# EasyEDA Pro project honglin-first_crt_smartphone-e4cb491d.epro, schematic Schematic2
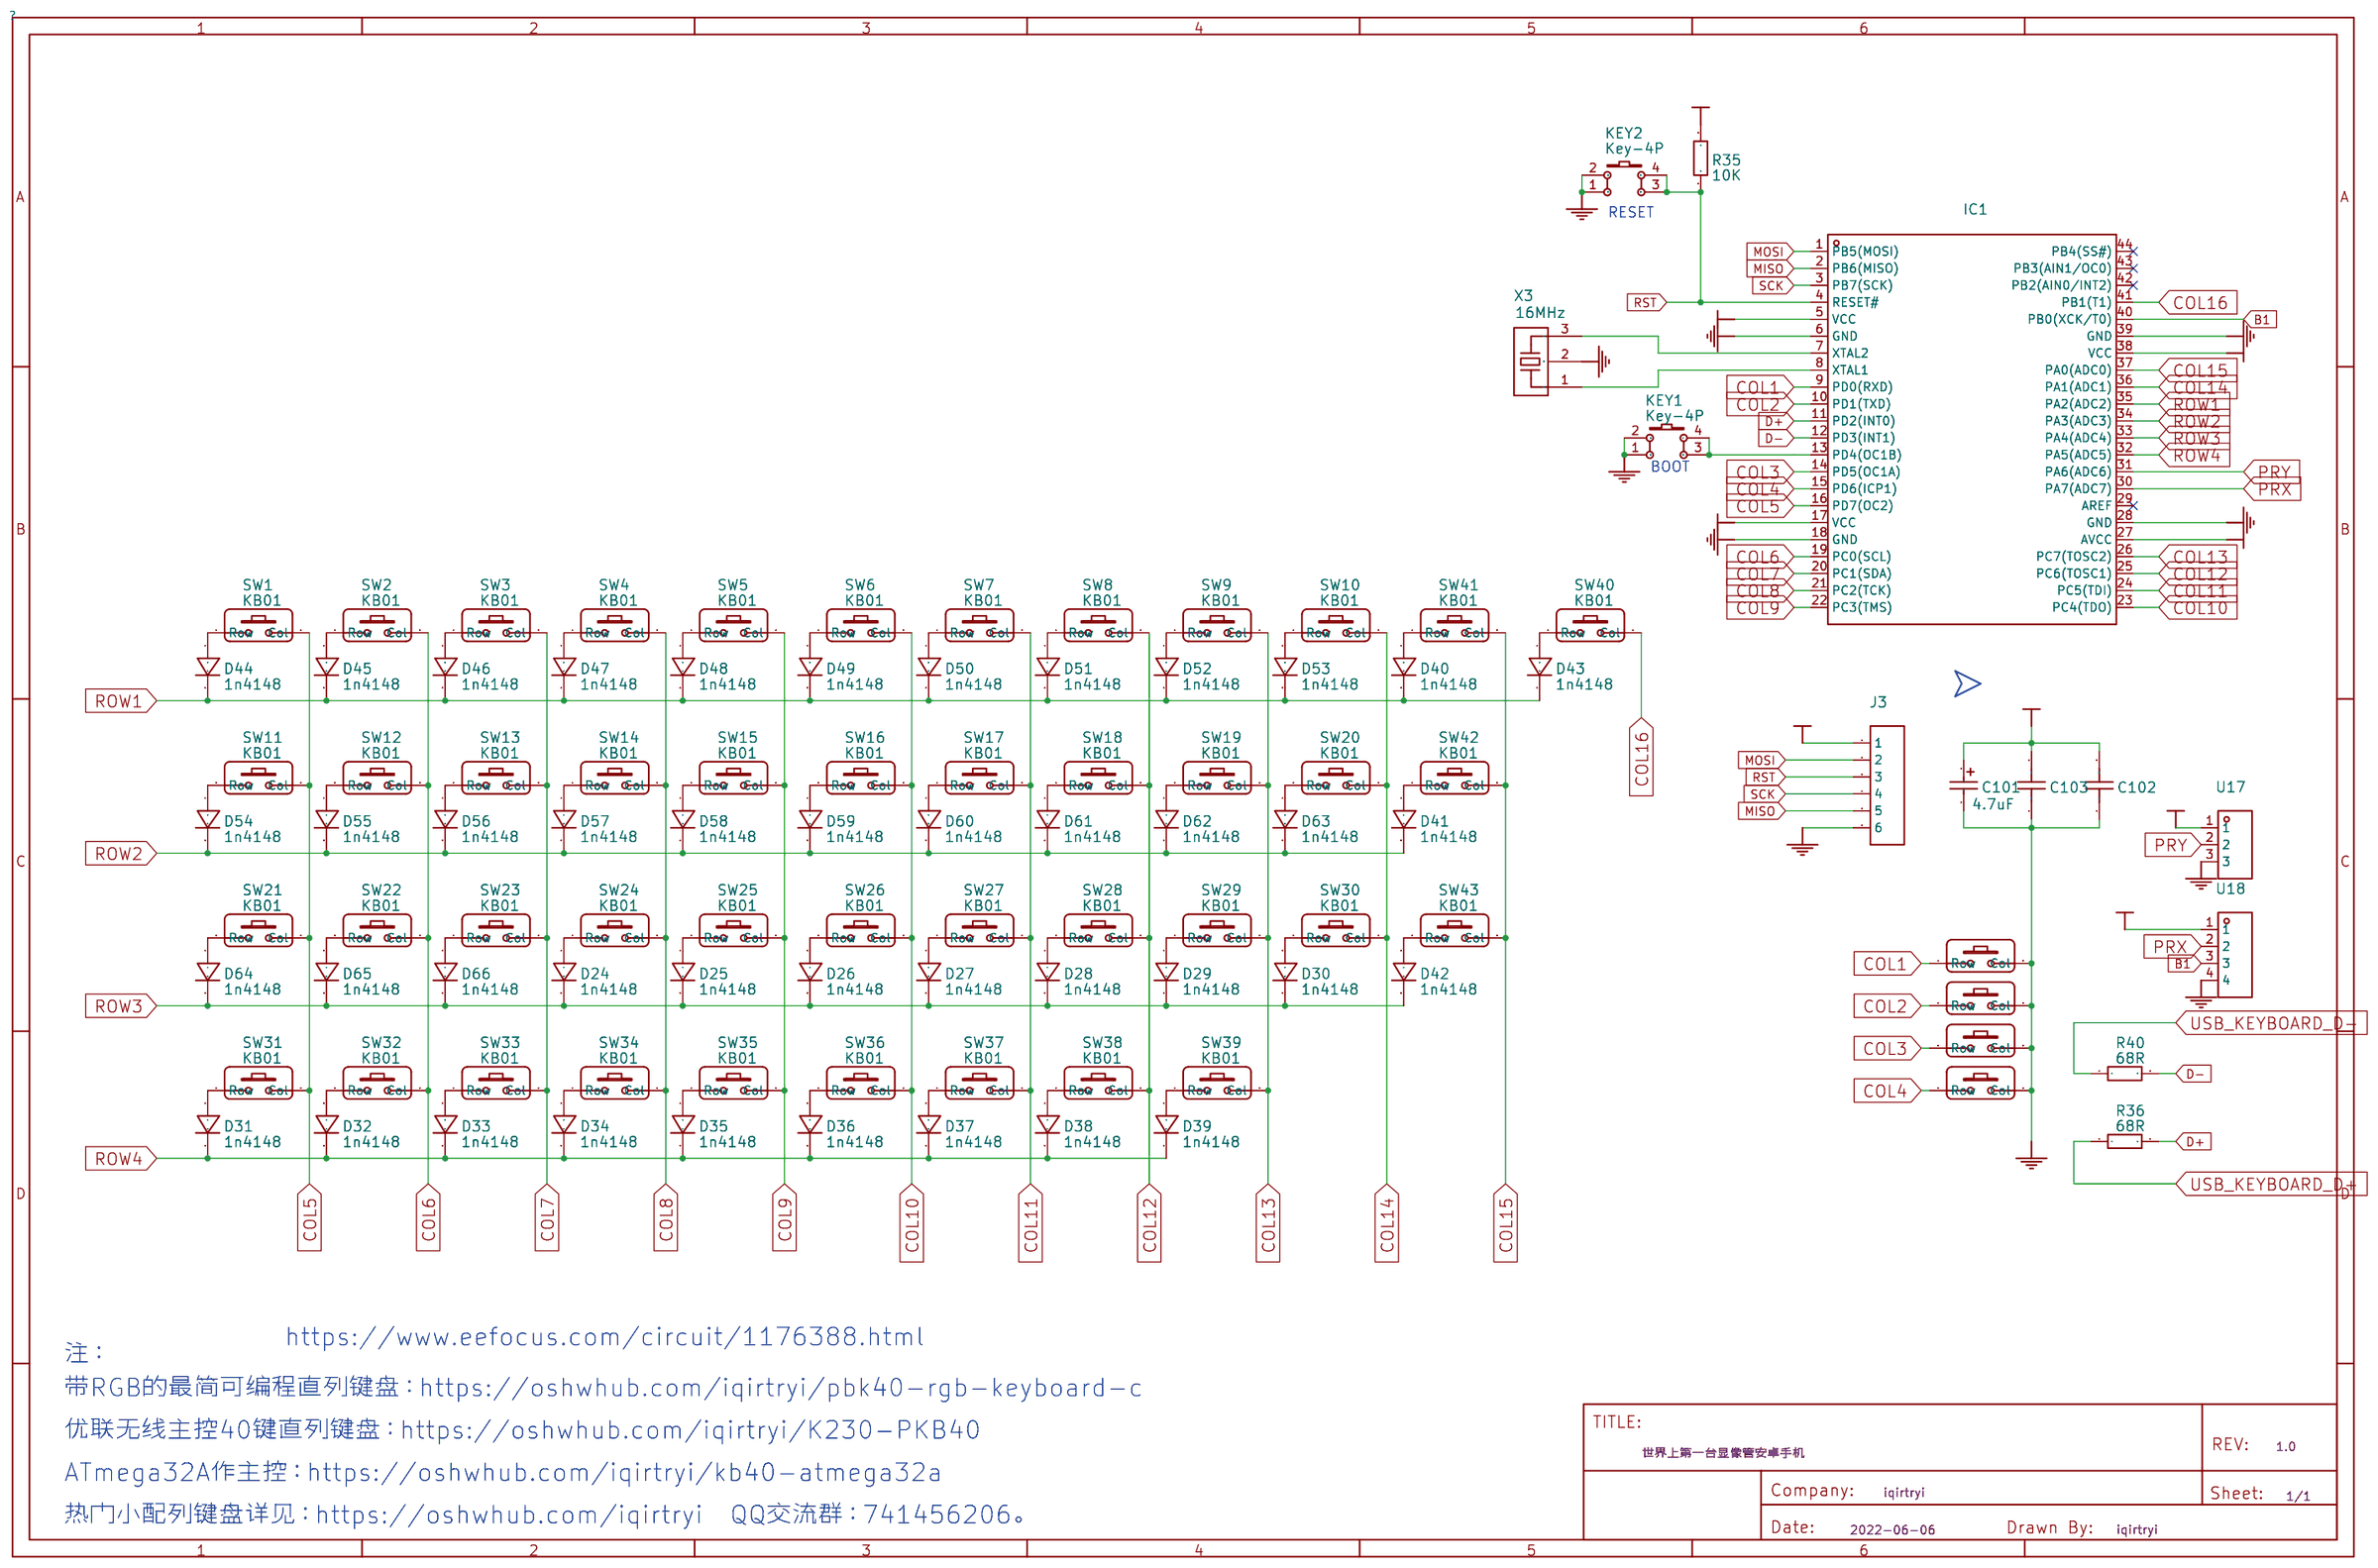
[diagram p6: schematic sheet]

## Parts
C101  4.7uF  [CAP-SMD_L3.2-W1.6-R-RD]
C102  0.1uF  [C0805]
C103  0.1uF  [C0805]
D24  1n4148  [LL-34_L3.5-W1.5-RD01]
D25  1n4148  [LL-34_L3.5-W1.5-RD01]
D26  1n4148  [LL-34_L3.5-W1.5-RD01]
D27  1n4148  [LL-34_L3.5-W1.5-RD01]
D28  1n4148  [LL-34_L3.5-W1.5-RD01]
D29  1n4148  [LL-34_L3.5-W1.5-RD01]
D30  1n4148  [LL-34_L3.5-W1.5-RD01]
D31  1n4148  [LL-34_L3.5-W1.5-RD01]
D32  1n4148  [LL-34_L3.5-W1.5-RD01]
D33  1n4148  [LL-34_L3.5-W1.5-RD01]
D34  1n4148  [LL-34_L3.5-W1.5-RD01]
D35  1n4148  [LL-34_L3.5-W1.5-RD01]
D36  1n4148  [LL-34_L3.5-W1.5-RD01]
D37  1n4148  [LL-34_L3.5-W1.5-RD01]
D38  1n4148  [LL-34_L3.5-W1.5-RD01]
D39  1n4148  [LL-34_L3.5-W1.5-RD01]
D40  1n4148  [LL-34_L3.5-W1.5-RD01]
D41  1n4148  [LL-34_L3.5-W1.5-RD01]
D42  1n4148  [LL-34_L3.5-W1.5-RD01]
D43  1n4148  [LL-34_L3.5-W1.5-RD01]
D44  1n4148  [LL-34_L3.5-W1.5-RD01]
D45  1n4148  [LL-34_L3.5-W1.5-RD01]
D46  1n4148  [LL-34_L3.5-W1.5-RD01]
D47  1n4148  [LL-34_L3.5-W1.5-RD01]
D48  1n4148  [LL-34_L3.5-W1.5-RD01]
D49  1n4148  [LL-34_L3.5-W1.5-RD01]
D50  1n4148  [LL-34_L3.5-W1.5-RD01]
D51  1n4148  [LL-34_L3.5-W1.5-RD01]
D52  1n4148  [LL-34_L3.5-W1.5-RD01]
D53  1n4148  [LL-34_L3.5-W1.5-RD01]
D54  1n4148  [LL-34_L3.5-W1.5-RD01]
D55  1n4148  [LL-34_L3.5-W1.5-RD01]
D56  1n4148  [LL-34_L3.5-W1.5-RD01]
D57  1n4148  [LL-34_L3.5-W1.5-RD01]
D58  1n4148  [LL-34_L3.5-W1.5-RD01]
D59  1n4148  [LL-34_L3.5-W1.5-RD01]
D60  1n4148  [LL-34_L3.5-W1.5-RD01]
D61  1n4148  [LL-34_L3.5-W1.5-RD01]
D62  1n4148  [LL-34_L3.5-W1.5-RD01]
D63  1n4148  [LL-34_L3.5-W1.5-RD01]
D64  1n4148  [LL-34_L3.5-W1.5-RD01]
D65  1n4148  [LL-34_L3.5-W1.5-RD01]
D66  1n4148  [LL-34_L3.5-W1.5-RD01]
IC1  ATMEGA32A-AU  [TQFP-44_L10.0-W10.0-P0.80-LS12.0-BL]
J3  Pin06  [PIN06]  (no BOM)
KEY1  Key-4P  [SW-SMD_4P-L5.1-W5.1-P3.70-LS6.5-TL-2]
KEY2  Key-4P  [SW-SMD_4P-L5.1-W5.1-P3.70-LS6.5-TL-2]
R35  10K  [R0805]
R36  68R  [R0805]
R40  68R  [R0805]
SW1  KB01  [6*6*5硅胶开关]
SW2  KB01  [6*6*5硅胶开关]
SW3  KB01  [6*6*5硅胶开关]
SW4  KB01  [6*6*5硅胶开关]
SW5  KB01  [6*6*5硅胶开关]
SW6  KB01  [6*6*5硅胶开关]
SW7  KB01  [6*6*5硅胶开关]
SW8  KB01  [6*6*5硅胶开关]
SW9  KB01  [6*6*5硅胶开关]
SW10  KB01  [6*6*5硅胶开关]
SW11  KB01  [6*6*5硅胶开关]
SW12  KB01  [6*6*5硅胶开关]
SW13  KB01  [6*6*5硅胶开关]
SW14  KB01  [6*6*5硅胶开关]
SW15  KB01  [6*6*5硅胶开关]
SW16  KB01  [6*6*5硅胶开关]
SW17  KB01  [6*6*5硅胶开关]
SW18  KB01  [6*6*5硅胶开关]
SW19  KB01  [6*6*5硅胶开关]
SW20  KB01  [6*6*5硅胶开关]
SW21  KB01  [6*6*5硅胶开关]
SW22  KB01  [6*6*5硅胶开关]
SW23  KB01  [6*6*5硅胶开关]
SW24  KB01  [6*6*5硅胶开关]
SW25  KB01  [6*6*5硅胶开关]
SW26  KB01  [6*6*5硅胶开关]
SW27  KB01  [6*6*5硅胶开关]
SW28  KB01  [6*6*5硅胶开关]
SW29  KB01  [6*6*5硅胶开关]
SW30  KB01  [6*6*5硅胶开关]
SW31  KB01  [6*6*5硅胶开关]
SW32  KB01  [6*6*5硅胶开关]
SW33  KB01  [6*6*5硅胶开关]
SW34  KB01  [6*6*5硅胶开关]
SW35  KB01  [6*6*5硅胶开关]
SW36  KB01  [6*6*5硅胶开关]
SW37  KB01  [6*6*5硅胶开关]
SW38  KB01  [6*6*5硅胶开关]
SW39  KB01  [6*6*5硅胶开关]
SW40  KB01  [6*6*5硅胶开关]
SW41  KB01  [6*6*5硅胶开关]
SW42  KB01  [6*6*5硅胶开关]
SW43  KB01  [6*6*5硅胶开关]
SW44  KB01  [6*6*5硅胶开关]
SW45  KB01  [6*6*5硅胶开关]
SW46  KB01  [6*6*5硅胶开关]
SW47  KB01  [6*6*5硅胶开关]
U17  XH2.54-3P 直插  [CONN-TH_XH2.54-3P]
U18  XH2.54_4P_直插  [CONN-TH_4P-P2.50-XH2.54-4P]
X3  16MHz  [OSC-SMD_3P-L3.2-W1.3-P1.2-L]

## Library data of the parts
C101 = TAJA106K010RNJ: Supplier: LCSC; Manufacturer: AVX; Supplier Part: C7177; JLCPCB Part Class: Extend
C102 C103 = 0.1uF: Supplier: LCSC; Supplier Part: C302043
D24-D66 = MCL4148-TR3: Supplier: LCSC; Manufacturer: VISHAY; Supplier Part: C146440; JLCPCB Part Class: Extended Part
IC1 = ATMEGA32A-AU: Supplier: LCSC; Manufacturer: MICROCHIP; Supplier Part: C5659; JLCPCB Part Class: Extended Part
J3 = Pin06: Supplier Part: C190819; Supplier: LCSC
KEY1 KEY2 = K2-1103DP-M4SW-04: Supplier Part: C1121873; Supplier: LCSC; Manufacturer: XKB Connectivity
R35 R36 R40 = QR0805F1KP05: Supplier: LCSC; Supplier Part: C176197; Manufacturer: Ever Ohms Tech
SW1-SW47 = 00
U17 = XH2.54-3P 直插: Supplier: LCSC; Supplier Part: C9900000727; Manufacturer: null; JLCPCB Part Class: Extended Part
U18 = XH2.54_4P_直插: Supplier: LCSC; Supplier Part: C9900008616; Manufacturer: null; JLCPCB Part Class: Extended Part
X3 = CSTCE16M0V53C-R0: Supplier: LCSC; Manufacturer: MuRata; Supplier Part: C91584

## Nets
GND: C101.2 C102.1 C103.1 IC1.6(GND) IC1.18(GND) IC1.28(GND) IC1.39(GND) J3.6 KEY1.1 KEY1.2 KEY2.1 KEY2.2 SW44.2(Col) SW45.2(Col) SW46.2(Col) SW47.2(Col) U17.3 U18.4 X3.2
VCC: C101.1 C102.2 C103.2 IC1.5(VCC) IC1.17(VCC) IC1.27(AVCC) IC1.38(VCC) J3.1 R35.2
B1: IC1.40(PB0(XCK/T0)) U18.3
BLDO2: U17.1 U18.1
COL1: IC1.9(PD0(RXD)) SW44.1(Row)
COL2: IC1.10(PD1(TXD)) SW45.1(Row)
COL3: IC1.14(PD5(OC1A)) SW46.1(Row)
COL4: IC1.15(PD6(ICP1)) SW47.1(Row)
COL5: IC1.16(PD7(OC2)) SW1.2(Col) SW11.2(Col) SW21.2(Col) SW31.2(Col)
COL6: IC1.19(PC0(SCL)) SW2.2(Col) SW12.2(Col) SW22.2(Col) SW32.2(Col)
COL7: IC1.20(PC1(SDA)) SW3.2(Col) SW13.2(Col) SW23.2(Col) SW33.2(Col)
COL8: IC1.21(PC2(TCK)) SW4.2(Col) SW14.2(Col) SW24.2(Col) SW34.2(Col)
COL9: IC1.22(PC3(TMS)) SW5.2(Col) SW15.2(Col) SW25.2(Col) SW35.2(Col)
COL10: IC1.23(PC4(TDO)) SW6.2(Col) SW16.2(Col) SW26.2(Col) SW36.2(Col)
COL11: IC1.24(PC5(TDI)) SW7.2(Col) SW17.2(Col) SW27.2(Col) SW37.2(Col)
COL12: IC1.25(PC6(TOSC1)) SW8.2(Col) SW18.2(Col) SW28.2(Col) SW38.2(Col)
COL13: IC1.26(PC7(TOSC2)) SW9.2(Col) SW19.2(Col) SW29.2(Col) SW39.2(Col)
COL14: IC1.36(PA1(ADC1)) SW10.2(Col) SW20.2(Col) SW30.2(Col)
COL15: IC1.37(PA0(ADC0)) SW41.2(Col) SW42.2(Col) SW43.2(Col)
COL16: IC1.41(PB1(T1)) SW40.2(Col)
D+: IC1.11(PD2(INT0)) R36.2
D-: IC1.12(PD3(INT1)) R40.2
MISO: IC1.2(PB6(MISO)) J3.5
MOSI: IC1.1(PB5(MOSI)) J3.2
PRX: IC1.30(PA7(ADC7)) U18.2
PRY: IC1.31(PA6(ADC6)) U17.2
ROW1: D40.2(K) D43.2(K) D44.2(K) D45.2(K) D46.2(K) D47.2(K) D48.2(K) D49.2(K) D50.2(K) D51.2(K) D52.2(K) D53.2(K) IC1.35(PA2(ADC2))
ROW2: D41.2(K) D54.2(K) D55.2(K) D56.2(K) D57.2(K) D58.2(K) D59.2(K) D60.2(K) D61.2(K) D62.2(K) D63.2(K) IC1.34(PA3(ADC3))
ROW3: D24.2(K) D25.2(K) D26.2(K) D27.2(K) D28.2(K) D29.2(K) D30.2(K) D42.2(K) D64.2(K) D65.2(K) D66.2(K) IC1.33(PA4(ADC4))
ROW4: D31.2(K) D32.2(K) D33.2(K) D34.2(K) D35.2(K) D36.2(K) D37.2(K) D38.2(K) D39.2(K) IC1.32(PA5(ADC5))
RST: IC1.4(RESET#) J3.3 KEY2.3 KEY2.4 R35.1
SCK: IC1.3(PB7(SCK)) J3.4
USB_KEYBOARD_D+: R36.1
USB_KEYBOARD_D-: R40.1
$2N1154: IC1.13(PD4(OC1B)) KEY1.3 KEY1.4
$2N1535: D24.1(A) SW24.1(Row)
$2N1536: D25.1(A) SW25.1(Row)
$2N1537: D26.1(A) SW26.1(Row)
$2N1538: D27.1(A) SW27.1(Row)
$2N1539: D28.1(A) SW28.1(Row)
$2N1540: D29.1(A) SW29.1(Row)
$2N1541: D30.1(A) SW30.1(Row)
$2N1542: D31.1(A) SW31.1(Row)
$2N1543: D32.1(A) SW32.1(Row)
$2N1544: D33.1(A) SW33.1(Row)
$2N1545: D34.1(A) SW34.1(Row)
$2N1546: D35.1(A) SW35.1(Row)
$2N1547: D36.1(A) SW36.1(Row)
$2N1548: D37.1(A) SW37.1(Row)
$2N1549: D38.1(A) SW38.1(Row)
$2N1550: D39.1(A) SW39.1(Row)
$2N1551: D40.1(A) SW41.1(Row)
$2N1552: D41.1(A) SW42.1(Row)
$2N1553: D42.1(A) SW43.1(Row)
$2N1554: D43.1(A) SW40.1(Row)
Net-(D44-1): D44.1(A) SW1.1(Row)
Net-(D45-1): D45.1(A) SW2.1(Row)
Net-(D46-1): D46.1(A) SW3.1(Row)
Net-(D47-1): D47.1(A) SW4.1(Row)
Net-(D48-1): D48.1(A) SW5.1(Row)
Net-(D49-1): D49.1(A) SW6.1(Row)
Net-(D50-1): D50.1(A) SW7.1(Row)
Net-(D51-1): D51.1(A) SW8.1(Row)
Net-(D52-1): D52.1(A) SW9.1(Row)
Net-(D53-1): D53.1(A) SW10.1(Row)
Net-(D54-1): D54.1(A) SW11.1(Row)
Net-(D55-1): D55.1(A) SW12.1(Row)
Net-(D56-1): D56.1(A) SW13.1(Row)
Net-(D57-1): D57.1(A) SW14.1(Row)
Net-(D58-1): D58.1(A) SW15.1(Row)
Net-(D59-1): D59.1(A) SW16.1(Row)
Net-(D60-1): D60.1(A) SW17.1(Row)
Net-(D61-1): D61.1(A) SW18.1(Row)
Net-(D62-1): D62.1(A) SW19.1(Row)
Net-(D63-1): D63.1(A) SW20.1(Row)
Net-(D64-1): D64.1(A) SW21.1(Row)
Net-(D65-1): D65.1(A) SW22.1(Row)
Net-(D66-1): D66.1(A) SW23.1(Row)
Net-(IC1-7): IC1.7(XTAL2) X3.3
Net-(IC1-8): IC1.8(XTAL1) X3.1

Not connected (* = marked no-connect by the designer): IC1 29(AREF)* 42(PB2(AIN0/INT2))* 43(PB3(AIN1/OC0))* 44(PB4(SS#))*

## Notes on the sheet
- RESET
- BOOT
- https://www.eefocus.com/circuit/1176388.html
- 注：
- 带RGB的最简可编程直列键盘：https://oshwhub.com/iqirtryi/pbk40-rgb-keyboard-c
- 优联无线主控40键直列键盘：https://oshwhub.com/iqirtryi/K230-PKB40
- ATmega32A作主控：https://oshwhub.com/iqirtryi/kb40-atmega32a
- 热门小配列键盘详见：https://oshwhub.com/iqirtryi  QQ交流群：741456206。
